# Altium schematic sheet 328P_Board.SchDoc: Plant Watering System
size A3; DrawnBy: Abzanov; Revision: 3.0; SheetNumber: 1; SheetTotal: 1
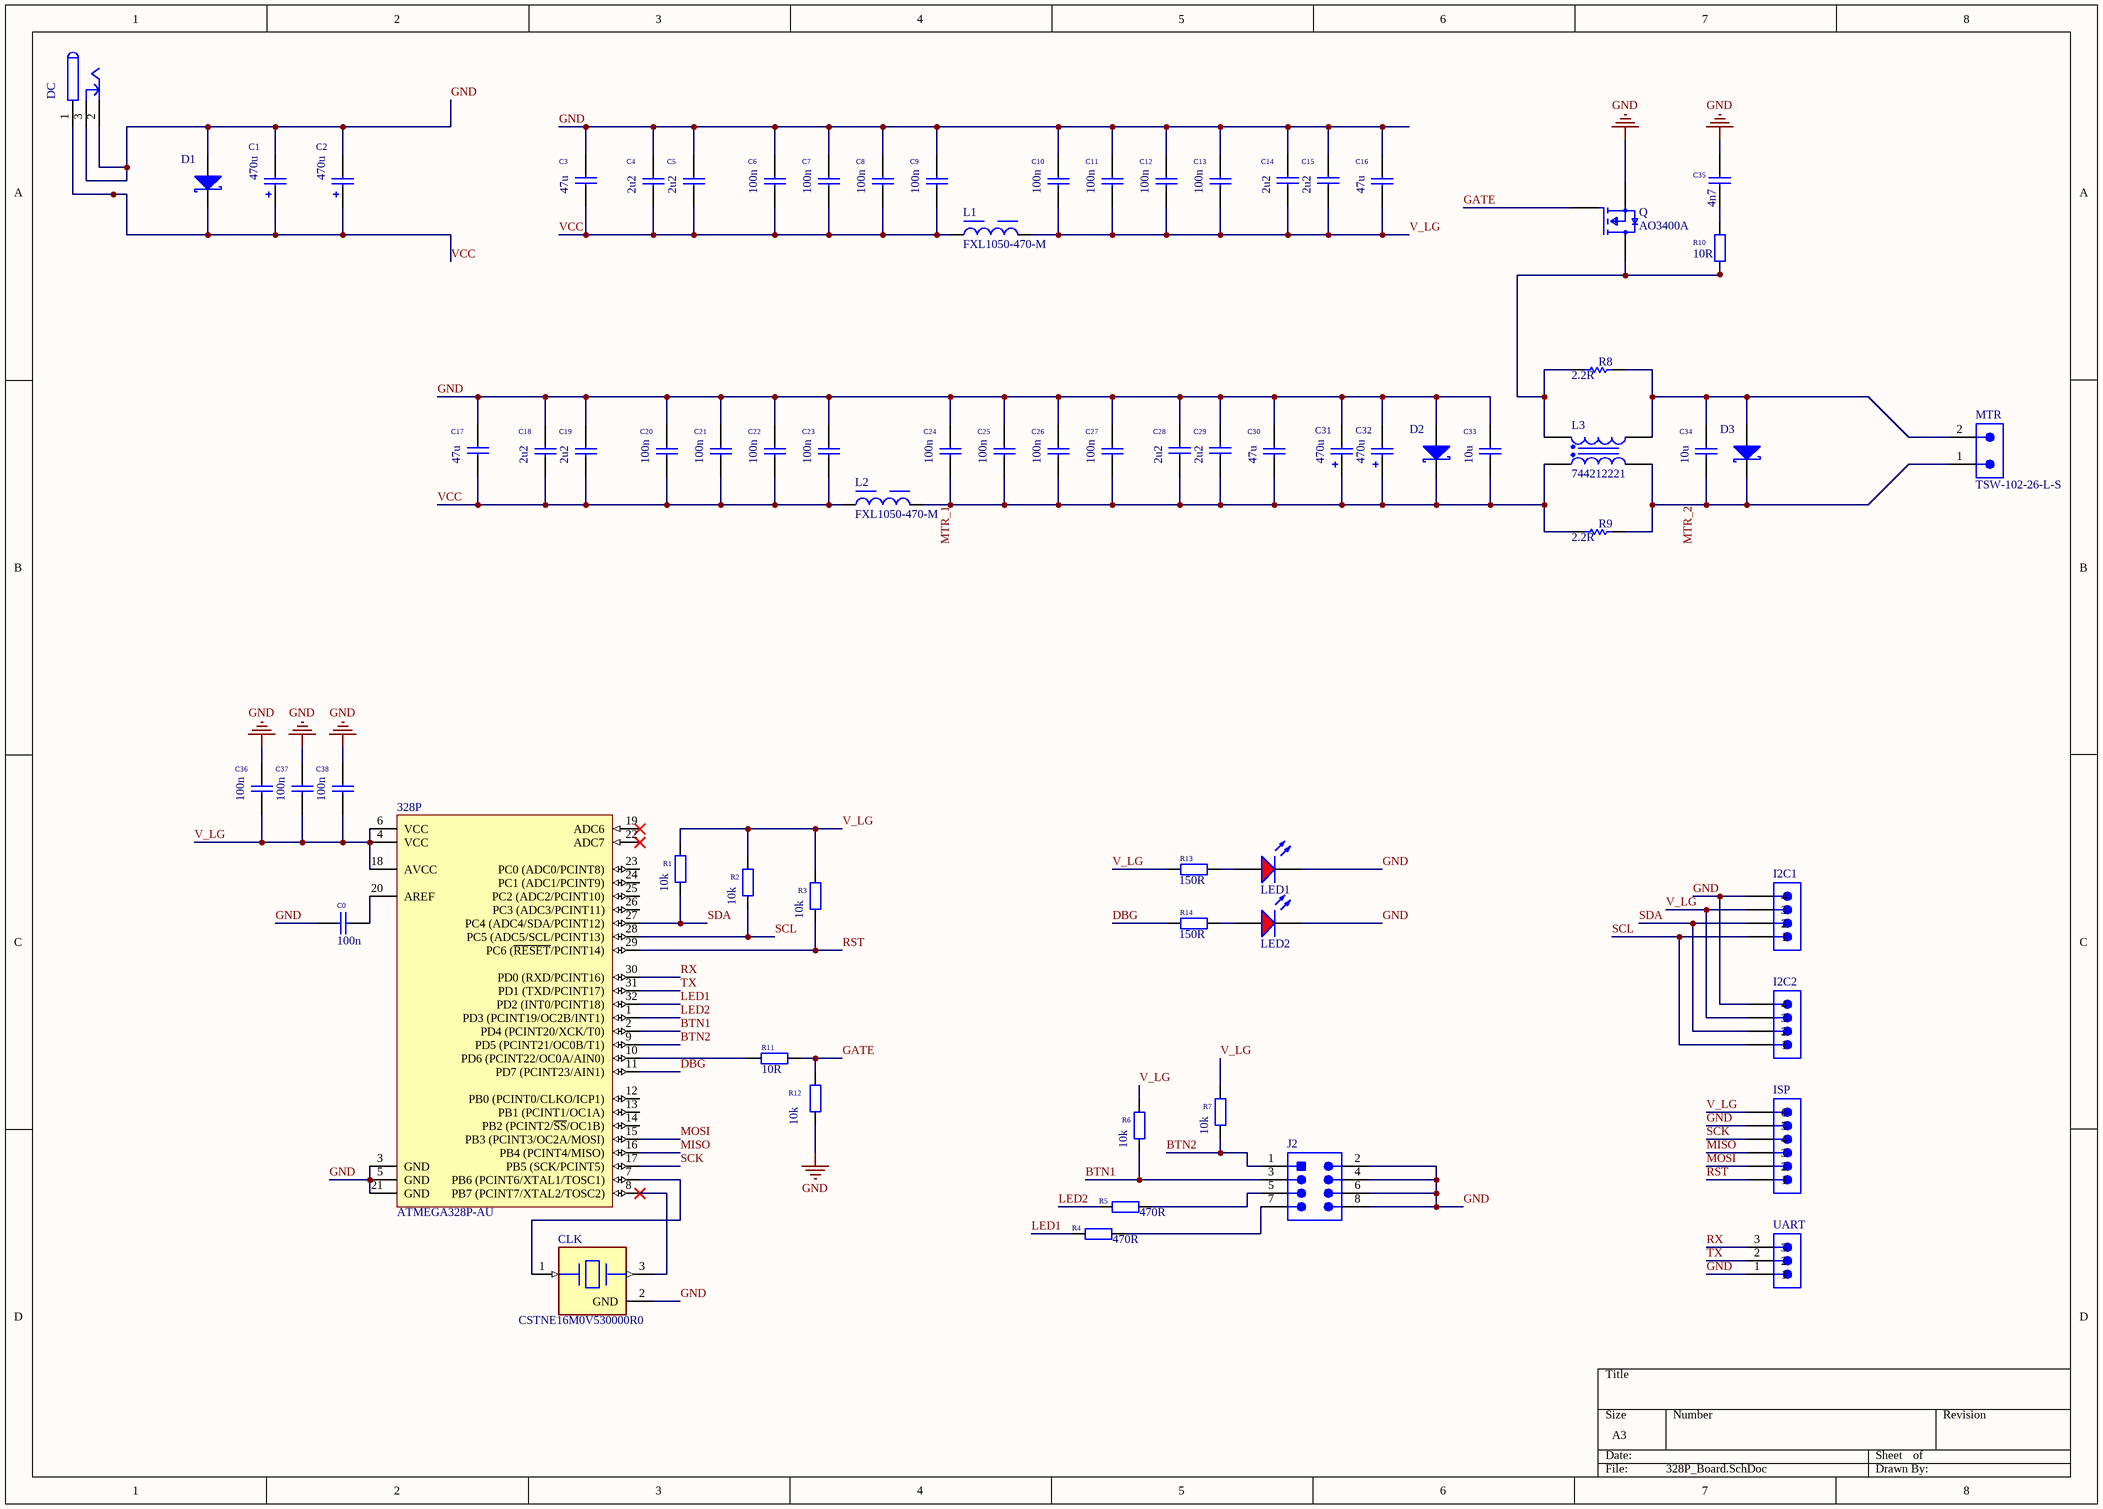
[diagram p0: 328P_Board.SchDoc]

## Parts
328P  ATMEGA328P-AU  [32A_L]
C0  100n  [CAPC1005X55]
C1  470u  [CAPAE100X105]
C2  470u  [CAPAE100X105]
C3  47u  [CAPC3225X270]
C4  2u2  [CAPC1608X90]
C5  2u2  [CAPC1608X90]
C6  100n  [CAPC1005X55]
C7  100n  [CAPC1005X55]
C8  100n  [CAPC1005X55]
C9  100n  [CAPC1005X55]
C10  100n  [CAPC1005X55]
C11  100n  [CAPC1005X55]
C12  100n  [CAPC1005X55]
C13  100n  [CAPC1005X55]
C14  2u2  [CAPC1608X90]
C15  2u2  [CAPC1608X90]
C16  47u  [CAPC3225X270]
C17  47u  [CAPC3225X270]
C18  2u2  [CAPC1608X90]
C19  2u2  [CAPC1608X90]
C20  100n  [CAPC1005X55]
C21  100n  [CAPC1005X55]
C22  100n  [CAPC1005X55]
C23  100n  [CAPC1005X55]
C24  100n  [CAPC1005X55]
C25  100n  [CAPC1005X55]
C26  100n  [CAPC1005X55]
C27  100n  [CAPC1005X55]
C28  2u2  [CAPC1608X90]
C29  2u2  [CAPC1608X90]
C30  47u  [CAPC3225X270]
C31  470u  [CAPAE100X105]
C32  470u  [CAPAE100X105]
C33  10u  [CAPC3216X180]
C34  10u  [CAPC3216X180]
C35  4n7  [CAPC1005X55]
C36  100n  [CAPC1005X55]
C37  100n  [CAPC1005X55]
C38  100n  [CAPC1005X55]
CLK  CSTNE16M0V530000R0  [FP-CSTNE16M0V530000R0-MFG]
D1  SSC54  [DIOM7959X262]  (value not drawn)
D2  SSC54  [DIOM7959X262]  (value not drawn)
D3  SSC54  [DIOM7959X262]  (value not drawn)
DC  694106301002  [KYCON_KLDX-0202]  (value not drawn)
I2C1  TSW-104-08-L-S  [SMTC-TSW-104-08-X-S]  (value not drawn)
I2C2  TSW-104-08-L-S  [SMTC-TSW-104-08-X-S]  (value not drawn)
ISP  TSW-106-07-L-S  [SMTC-TSW-106-07-X-S]  (value not drawn)
J2  TSW-104-08-L-D  [SMTC-TSW-104-08-L-D_V]  (value not drawn)
L1  FXL1050-470-M  [FXL1050-470-M-Footprint-1]
L2  FXL1050-470-M  [FXL1050-470-M-Footprint-1]
L3  744212221  [WE-SL1_L6.5W3.6H1.65]
LED1  Red  [LEDC2012X90]  (value not drawn)
LED2  Red  [LEDC2012X90]  (value not drawn)
MTR  TSW-102-26-L-S  [SMTC-TSW-102-26-XX-S]
Q  AO3400A  [FP-SOT23-IPC_C]
R1  10k  [RESC1005X40]
R2  10k  [RESC1005X40]
R3  10k  [RESC1005X40]
R4  470R  [RESC1005X40]
R5  470R  [RESC1005X40]
R6  10k  [RESC1005X40]
R7  10k  [RESC1005X40]
R8  value 2.2R  [RC2512JK-7W2R2L-Footprint-1]  (hidden comment: RC2512JK-7W2R2L)
R9  value 2.2R  [RC2512JK-7W2R2L-Footprint-1]  (hidden comment: RC2512JK-7W2R2L)
R10  10R  [RESC2012X65]
R11  10R  [RESC2012X65]
R12  10k  [RESC1005X40]
R13  150R  [RESC1005X40]
R14  150R  [RESC1005X40]
UART  TSW-103-07-T-S  [SMTC-TSW-103-07-X-S]  (value not drawn)

## Nets
GND: 328P.3(GND) 328P.5(GND) 328P.21(GND) C0.1 C1.2 C2.2 C3.1 C4.1 C5.1 C6.1 C7.1 C8.1 C9.1 C10.1 C11.1 C12.1 C13.1 C14.2 C15.2 C16.2 C17.1 C18.1 C19.1 C20.1 C21.1 C22.1 C23.1 C24.1 C25.1 C26.1 C27.1 C28.2 C29.2 C30.2 C31.2 C32.2 C33.2 C35.2 C36.1 C37.1 C38.1 CLK.2(GND) D1.2(A) D2.2(A) DC.2 DC.3 I2C1.4 I2C2.4 ISP.5 J2.2 J2.4 J2.6 J2.8 LED1.1(K) LED2.1(K) Q.2(S) R12.2 UART.1
BTN1: 328P.2(PD4_(PCINT20/XCK/T0)) J2.3 R6.2
BTN2: 328P.9(PD5_(PCINT21/OC0B/T1)) J2.1 R7.2
DBG: 328P.11(PD7_(PCINT23/AIN1)) R14.1
GATE: Q.1(G) R11.1 R12.1
LED1: 328P.32(PD2_(INT0/PCINT18)) R4.1
LED2: 328P.1(PD3_(PCINT19/OC2B/INT1)) R5.1
MISO: 328P.16(PB4_(PCINT4/MISO)) ISP.3
MOSI: 328P.15(PB3_(PCINT3/OC2A/MOSI)) ISP.2
MTR_1: C24.2 C25.2 C26.2 C27.2 C28.1 C29.1 C30.1 C31.1 C32.1 C33.1 D2.1(K) L2.2 L3.1 R9.1
MTR_2: C34.1 D3.1(K) L3.5 MTR.1 R9.2
RST: 328P.29(PC6_(~{RESET}/PCINT14)) ISP.1 R3.2
RX: 328P.30(PD0_(RXD/PCINT16)) UART.3
SCK: 328P.17(PB5_(SCK/PCINT5)) ISP.4
SCL: 328P.28(PC5_(ADC5/SCL/PCINT13)) I2C1.1 I2C2.1 R2.2
SDA: 328P.27(PC4_(ADC4/SDA/PCINT12)) I2C1.2 I2C2.2 R1.2
TX: 328P.31(PD1_(TXD/PCINT17)) UART.2
V_LG: 328P.4(VCC) 328P.6(VCC) 328P.18(AVCC) C10.2 C11.2 C12.2 C13.2 C14.1 C15.1 C16.1 C36.2 C37.2 C38.2 I2C1.3 I2C2.3 ISP.6 L1.2 R1.1 R2.1 R3.1 R6.1 R7.1 R13.1
VCC: C1.1 C2.1 C3.2 C4.2 C5.2 C6.2 C7.2 C8.2 C9.2 C17.2 C18.2 C19.2 C20.2 C21.2 C22.2 C23.2 D1.1(K) DC.1 L1.1 L2.1
Net328P_7: 328P.7(PB6_(PCINT6/XTAL1/TOSC1)) CLK.1(Input)
Net328P_8: 328P.8(PB7_(PCINT7/XTAL2/TOSC2)) CLK.3(Output)
Net328P_10: 328P.10(PD6_(PCINT22/OC0A/AIN0)) R11.2
Net328P_20: 328P.20(AREF) C0.2
NetC34_2: C34.2 D3.2(A) L3.4 MTR.2 R8.2
NetC35_1: C35.1 R10.2
NetJ2_5: J2.5 R5.2
NetJ2_7: J2.7 R4.2
NetL3_3: L3.3 Q.3(D) R8.1 R10.1
NetLED1_2: LED1.2(A) R13.2
NetLED2_2: LED2.2(A) R14.2

Not connected (* = marked no-connect by the designer): 328P 12(PB0_(PCINT0/CLKO/ICP1)) 13(PB1_(PCINT1/OC1A)) 14(PB2_(PCINT2/~{SS}/OC1B)) 19(ADC6)* 22(ADC7)* 23(PC0_(ADC0/PCINT8)) 24(PC1_(ADC1/PCINT9)) 25(PC2_(ADC2/PCINT10)) 26(PC3_(ADC3/PCINT11))

## Library data of the parts
328P = CMP-00014-1: RISC Microcontroller, 8-Bit, FLASH, AVR RISC CPU, 20MHz, CMOS, PQFP32; Qualification Status: Not Qualified; Power Supplies: 2.5; Package Body Material: Plastic; Peripherals: POR,PWM,WDT; Max Supply Voltage: 5.5V; Number of I/O Lines: 23; Min Supply Voltage: 4.5V; Max Supply Current: 9mA; Interface: SPI,USART; Time @ Peak Reflow Temperature-Max (s): 40s; Nominal Supply Voltage: 5V; Height - Seated (Max): 1.2mm; RoHS Compliant: Yes; Terminal Form: Gull Wing; JESD-30 Code: S-PQFP-G32; Peak Reflow Temperature (Cel): 260°C; Package Shape: Square; Temperature Grade: INDUSTRIAL; Technology: CMOS; Terminal Position: QUAD; Case/Package: TQFP; Reach SVHC Compliant: Yes; Surface Mount: Yes; Width: 7mm; Terminal Pitch: 0.8mm; Clock Frequency: 20MHz; Terminal Finish: Tin; Max Operating Temperature: 85°C; Length: 7mm; JESD-609 Code: e3; Min Operating Temperature: -40°C; Moisture Sensitivity Level: 3; Pins: 32
C0 C6-C13 C20-C27 C36-C38 = 1066: Ceramic Chip Capacitor; Manufacturer: Kemet; Manufacturer ID: C0402C104K4RAC; ID: 1066; Type: MLCC; Voltage: 16V; Characteristic: X7R; Tolerance: ±15%; UBiKS Number: UBiKS-C00001I; Value: 100n; Dielectric: Ceramic; Footprint / Size: C0402; Farnell: 1288252; Digikey: 399-3521-1-ND; Distributor 3: Mouser; Distributor Number 3: 80-C0402C104K4RAUTO; LCSC Part Number: C1525; Unit Price: 0; Quantity: 0; ComponentLink1Description: Website; ComponentLink1URL: http://kemet.com/; ComponentLink2Description: Datasheet; ComponentLink2URL: http://www.kemet.com/kemet/web/homepage/kechome.nsf/vapubfiles/F3102_X7R.pdf/$file/F3102_X7R.pdf
C1 C2 C31 C32 = 1097: Aluminum Electrolytic Capacitors; Manufacturer: Panasonic; Manufacturer ID: EEE-FK1E471P; ID: 1097; Type: Aluminium/Electrolytic; Voltage: 25V; Tolerance: ±20%; UBiKS Number: UBiKS-C00031X; Value: 470u; Dielectric: Electrolyt; Footprint / Size: CAPAE10083X102M; Farnell: 9695800; Digikey: PCE3805CT-ND; Distributor 4: Wuerth Elektronik; Distributor Number 4: 865080457015; Unit Price: 0; Quantity: 0; ComponentLink1Description: Website; ComponentLink1URL: http://industrial.panasonic.com/; ComponentLink2Description: Datasheet; ComponentLink2URL: http://industrial.panasonic.com/www-data/pdf/ABA0000/ABA0000CE120.pdf
C3 C16 C17 C30 = 1207: Ceramic Chip Capacitor; Manufacturer: Taiyo Yuden; Manufacturer ID: EMK325BJ476MM-T; ID: 1207; Type: MLCC; Voltage: 16V; Characteristic: X5R; Tolerance: ±20%; UBiKS Number: UBiKS-C00115P; Value: 47u; Dielectric: Ceramic; Footprint / Size: C1210; Farnell: 1611919; Digikey: 587-1436-2-ND; Unit Price: 0; Quantity: 0; ComponentLink1Description: Website; ComponentLink1URL: http://www.yuden.co.jp/; ComponentLink2Description: Datasheet; ComponentLink2URL: http://www.yuden.co.jp/ut/product/pdf/djmk_e.pdf
C4 C5 C14 C15 C18 C19 C28 C29 = 1206: Ceramic Chip Capacitor; Manufacturer: Kemet; Manufacturer ID: C0603C225K4PACTU; ID: 1206; Type: MLCC; Voltage: 16V; Characteristic: X5R; Tolerance: ±10%; UBiKS Number: UBiKS-C00114J; Value: 2u2; Dielectric: Ceramic; Footprint / Size: C0603; Farnell: 1288203; ComponentLink1Description: Website; ComponentLink1URL: http://kemet.com/; ComponentLink2Description: Datasheet; ComponentLink2URL: http://www.kemet.com/kemet/web/homepage/kechome.nsf/vapubfiles/F3102_X5R.pdf/$file/F3102_X5R.pdf
C33 C34 = 1283: Ceramic Chip Capacitor; Manufacturer: Samsung; Manufacturer ID: CL31A106MBHNNNE; ID: 1283; Type: MLCC; Voltage: 50V; Characteristic: X5R; Tolerance: ±20%; UBiKS Number: UBiKS-C00170P; Value: 10u; Dielectric: Ceramic; Footprint / Size: C1206; Digikey: 1276-6736-1-ND; Distributor Number 3: 187-CL31B106KBHNNNE; Distributor 4: Wuerth Elektronik; Distributor Number 4: 885012108022; LCSC Part Number: C13585; ComponentLink1Description: Website; ComponentLink1URL: https://www.samsungsem.com/; ComponentLink2Description: Datasheet; ComponentLink2URL: www.samsungsem.com/kr/support/product-search/mlcc/CL21A475KBQNNNE.jsp
C35 = 1086: Ceramic Chip Capacitor; Manufacturer: Kemet; Manufacturer ID: C0402C472K5RAC; ID: 1086; Type: MLCC; Voltage: 50V; Characteristic: X7R; Tolerance: ±15%; UBiKS Number: UBiKS-C00021S; Value: 4n7; Dielectric: Ceramic; Footprint / Size: C0402; Farnell: 1414594; Unit Price: 0; Quantity: 0; ComponentLink1Description: Website; ComponentLink1URL: http://kemet.com/; ComponentLink2Description: Datasheet; ComponentLink2URL: http://www.kemet.com/kemet/web/homepage/kechome.nsf/vapubfiles/F3102_X7R.pdf/$file/F3102_X7R.pdf
CLK = CMP-00020-1: Ceramic Resonator, 16MHz Nom; Frequency Tolerance: 5000ppm; Frequency Stability: 0.3%; Operating Frequency-Nom: 160; Reach SVHC Compliant: Yes; Min Operating Temperature: -40°C; Crystal/Resonator Type: CERAMIC RESONATOR; Mounting Technology: Surface Mount; Max Operating Temperature: 85°C; RoHS Compliant: Yes
D1-D3 = 4003: Schottky Diode; Manufacturer: Vishay; Manufacturer ID: SSC54-E3/9AT; ID: 4003; UBiKS Number: UBiKS-D00002P; Type: Schottky; Footprint / Size: D_SMC; Farnell: 1336559; Digikey: SSC54-E3/9ATGICT-ND; Distributor 3: Mouser; Distributor Number 3: 625-SSC54-E3/9AT; LCSC Part Number: C16103; ComponentLink1Description: Website; ComponentLink1URL: http://www.vishay.com/; ComponentLink2Description: Datasheet; ComponentLink2URL: http://www.vishay.com/docs/88885/88885.pdf
DC = 9655: DC Power Jack, 5.5x2.1mm, 6.4mm Opening DC power jack; Manufacturer: Wuerth Elektronik; ID: 9655; Value: 3; Pitch: 4.00mm; SMD/THT: THT; Serie: WR-DC; UBiKS Number: UBiKS-P00127T; Type: W2B - Power; Manufacturer ID: 694106301002; Orientation: H; Footprint / Size: DCJACK-5.5x2.1; Distributor 3: Mouser; Distributor Number 3: 806-KLDX-0202-A; Distributor 4: Wuerth Elektronik; Distributor Number 4: 694106301002; ComponentLink1Description: Website; ComponentLink1URL: https://www.we-online.com/en/components/products/DC_RIGHT_ANGLED_6_4_69410X301002; ComponentLink2Description: Datasheet; ComponentLink2URL: https://www.we-online.com/components/media/o664242v410%20info-wr-dc-power-jacks-connector.pdf
I2C1 I2C2 = CMP-00016-1: Board Connector, 4 Contact(s), 1 Row(s), Male, Straight, Solder Terminal; Manufacturer Series: TSW; Mating Information: MULTIPLE MATING PARTS AVAILABLE; Additional Feature: E.L.P.; IEC Conformance: No; Number of Contacts: 4; Option: General Purpose; Number of Rows Loaded: 1; Terminal Pitch: 2.54mm; RoHS Compliant: Yes; Contact Material: Bronze; Connector Type: BOARD CONNECTOR; Contact Finish - Mating: GOLD (10) OVER NICKEL (50); Mounting Style: STRAIGHT; JESD-609 Code: e3; MIL Conformance: No; Termination: Solder; Contact Finish - Termination: MATTE TIN OVER NICKEL (50); Filter Feature: No; Reach SVHC Compliant: Yes; DIN Conformance: No; Mixed Contacts: No; Contact Gender: Male; Mounting Technology: Board
ISP = CMP-00027-1: Board Connector, 6 Contact(s), 1 Row(s), Male, Straight, 0.1 inch Pitch, Solder Terminal, Black Insulator, Receptacle; DIN Conformance: No; Number Of Connectors: 1; Reference Standard: UL; PCB Contact Pattern: RECTANGULAR; Reliability: COMMERCIAL; Option: General Purpose; Number of Contacts: 6; Plating Thickness: 10uin; Mating Information: MULTIPLE MATING PARTS AVAILABLE; Additional Feature: E.L.P.; Contact Style: SQ PIN-SKT; Terminal Length: 0.1inch; Mixed Contacts: No; MIL Conformance: No; Terminal Pitch: 2.54mm; Body Breadth: 0.1inch; Body/Shell Style: RECEPTACLE; Body Depth: 0.1inch; Filter Feature: No; Termination: Solder; Contact Material: Bronze; Number Of PCB Rows: 1; Contact Gender: Male; Insulation Material: Glass; Contact Finish - Termination: Matte Tin (Sn) - with Nickel (Ni) barrier; Reach SVHC Compliant: Yes; Connector Type: BOARD CONNECTOR; Contact Pattern: RECTANGULAR; Insulation Color: Black; JESD-609 Code: e3; Contact Finish - Mating: GOLD (10) OVER NICKEL (50); Number of Rows Loaded: 1; RoHS Compliant: Yes; Mounting Style: STRAIGHT; IEC Conformance: No; Mating Contact Pitch: 0.1inch; Mounting Technology: Board; Flammability Rating: UL94 V-0
J2 = CMP-00029-1: Board Connector, 8 Contact(s), 2 Row(s), Male, Straight, 0.1 inch Pitch, Solder Terminal, Black Insulator, Receptacle; DIN Conformance: No; Mating Information: MULTIPLE MATING PARTS AVAILABLE; Plating Thickness: 10uin; Contact Pattern: RECTANGULAR; Additional Feature: E.L.P.; Number of Rows Loaded: 2; Reference Standard: UL; Reliability: COMMERCIAL; Number of Contacts: 8; Option: General Purpose; Number Of Connectors: 1; Contact Style: SQ PIN-SKT; PCB Contact Row Spacing: 5.08mm; Contact Finish - Termination: Matte Tin (Sn) - with Nickel (Ni) barrier; Mixed Contacts: No; MIL Conformance: No; Connector Type: BOARD CONNECTOR; Contact Material: Bronze; Terminal Length: 0.2inch; Contact Finish - Mating: GOLD (10) OVER NICKEL (50); Filter Feature: No; IEC Conformance: No; Terminal Pitch: 2.54mm; PCB Contact Pattern: RECTANGULAR; Mating Contact Pitch: 0.1inch; Reach SVHC Compliant: Yes; RoHS Compliant: Yes; Body Breadth: 0.1inch; Body/Shell Style: RECEPTACLE; Number Of PCB Rows: 2; Mating Contact Row Spacing: 0.1inch; JESD-609 Code: e3; Insulation Material: Glass; Mounting Technology: Board; Contact Gender: Male; Termination: Solder; Insulation Color: Black; Mounting Style: STRAIGHT; Body Depth: 0.1inch
L1 L2 = CMP-00038-1
L3 = CMP-00022-1: Data Line Filter, 2 Function(s), 80V, 0.3A, 4 Pin(s); Current Rating: 300mA; DC Resistance-Max: 280mR; Approvals: ULV; Output Impedance: 1.2kR; Value: 220uH; Channels: 2; Width: 3.6mm; Terminal Finish: Copper; Reach SVHC Compliant: Yes; Length: 6.5mm; Max Operating Temperature: 105°C; Height: 1.65mm; JESD-609 Code: e1; RoHS Compliant: Yes; Voltage Rating: 80V; Filter Type: DATA LINE FILTER; Min Operating Temperature: -40°C; Packaging: Tape and Reel; Mounting Technology: Surface Mount
LED1 LED2 = 6010: SMD Chip LED; Manufacturer: Avago; Manufacturer ID: HSMS-C170; ID: 6010; Type: Standard LED; UBiKS Number: UBiKS-V00002H; Color: red; Footprint / Size: LED0805; Farnell: 5790839; Digikey: 160-1422-6-ND; Distributor 3: Mouser; Distributor Number 3: 630-HSMS-C170; Distributor 4: Wuerth; Distributor Number 4: 150080RS75000; ComponentLink1Description: Website; ComponentLink1URL: http://www.avagotech.com/; ComponentLink2Description: Datasheet; ComponentLink2URL: http://www.avagotech.com/docs/AV02-0376EN; LCSC Part Number: C84256
MTR = CMP-00036-2: Board Connector, 2 Contact(s), 1 Row(s), Male, Straight, 0.1 inch Pitch, Solder Terminal, Black Insulator, Receptacle; Reference Standard: UL; Mating Information: MULTIPLE MATING PARTS AVAILABLE; PCB Contact Pattern: RECTANGULAR; Plating Thickness: 10uin; Number of Rows Loaded: 1; Reliability: COMMERCIAL; Option: General Purpose; DIN Conformance: No; Additional Feature: E.L.P.; Number of Contacts: 2; Contact Style: SQ PIN-SKT; Mounting Technology: Board; Terminal Length: 0.126inch; Connector Type: BOARD CONNECTOR; Insulation Material: Glass; Terminal Pitch: 2.54mm; Contact Finish - Termination: Matte Tin (Sn) - with Nickel (Ni) barrier; Contact Gender: Male; Body Depth: 0.1inch; Number Of Connectors: 1; IEC Conformance: No; Body Breadth: 0.1inch; MIL Conformance: No; Flammability Rating: UL94 V-0; Number Of PCB Rows: 1; Mounting Style: STRAIGHT; Contact Pattern: RECTANGULAR; Mating Contact Pitch: 0.1inch; RoHS Compliant: Yes; Contact Material: Bronze; JESD-609 Code: e3; Filter Feature: No; Termination: Solder; Contact Finish - Mating: GOLD (10) OVER NICKEL (50); Reach SVHC Compliant: Yes; Insulation Color: Black; Body/Shell Style: RECEPTACLE; Mixed Contacts: No
Q = CMP-00027-1: Small Signal Field-Effect Transistor, 5.7A I(D), 30V, 1-Element, N-Channel, Silicon, Metal-oxide Semiconductor FET; Operating Mode: ENHANCEMENT MODE; Drain-source On Resistance-Max: 26.5mR; Number of Elements: 1; Transistor Application: SWITCHING; Package Body Material: Plastic; Drain Current-Max (ID): 5.7A; Surface Mount: Yes; Package Style: SMALL OUTLINEMeter; Polarity/Channel Type: N-CHANNEL; Package Shape: Rectangular; Reach SVHC Compliant: Yes; FET Technology: METAL-OXIDE SEMICONDUCTOR; Terminal Position: DUAL; Pins: 3; Transistor Element Material: SILICON; DS Breakdown Voltage-Min: 30V; JESD-30 Code: R-PDSO-G3; Terminal Form: Gull Wing; RoHS Compliant: Yes
R1-R3 R6 R7 R12 = 2123: Resistor; Manufacturer: Multicomp; Manufacturer ID: MC 0.0625W 0402 1% 10K; ID: 2123; Element Type: Thick Film; Tolerance: ±1%; Power rating: 0.063W; Temperatur coeff: ±100ppm/°C; UBiKS Number: UBiKS-R00007H; Type: Standard; Value: 10k; Footprint / Size: R0402; Farnell: 1358069; LCSC Part Number: C25744; ComponentLink1Description: Website; ComponentLink2Description: Datasheet; ComponentLink2URL: http://www.farnell.com/datasheets/318400.pdf
R4 R5 = 2151: Resistor; Manufacturer: Multicomp; Manufacturer ID: MC 0.0625W 0402 1% 470R; ID: 2151; Element Type: Thick Film; Tolerance: ±1%; Power rating: 0.063W; Temperatur coeff: ±100ppm/°C; UBiKS Number: UBiKS-R00035K; Type: Standard; Value: 470R; Footprint / Size: R0402; Farnell: 1358034; LCSC Part Number: C25117; ComponentLink1Description: Website; ComponentLink2Description: Datasheet; ComponentLink2URL: http://www.farnell.com/datasheets/318400.pdf
R8 R9 = CMP-00021-2: Fixed Resistor, Metal Glaze/thick Film, 2W, 2.2ohm, 200V, 5% +/-Tol, 200ppm/Cel, Surface Mount, 2512; Package Width: 3.1mm; Package Length: 6.35mm; Additional Feature: LASER TRIMMABLE; Temperature Coefficient (ppm/Cel): 200; Rated Temperature: 70°C; Package Height: 0.55mm; RoHS Compliant: Yes; Technology: METAL GLAZE/THICK FILM; Min Operating Temperature: -55°C; JESD-609 Code: e3; Packaging: Tape and Reel; Construction: Chip; Mounting Technology: Surface Mount; Resistor Type: FIXED RESISTOR; Working Voltage: 200V; Pins: 2; Terminal Finish: Nickel; Termination: Wraparound; Case/Package: 2512; Max Operating Temperature: 155°C; Power: 2W; Tolerance: 5%; Reach SVHC Compliant: Yes; Package Shape: Rectangular
R10 R11 = 2526: Resistor; Manufacturer: Multicomp; Manufacturer ID: MC 0.1W 0805 1% 10R; ID: 2526; Element Type: Thick Film; Tolerance: ±1%; Power rating: 0.1W; Temperatur coeff: ±200ppm/°C; UBiKS Number: UBiKS-R00342J; Type: Standard; Value: 10R; Footprint / Size: R0805; Farnell: 9332421; LCSC Part Number: C17415; Unit Price: 0; Quantity: 0; ComponentLink1Description: Website; ComponentLink2Description: Datasheet; ComponentLink2URL: http://www.farnell.com/datasheets/34922.pdf
R13 R14 = 2219: Resistor; Manufacturer: Multicomp; Manufacturer ID: MC 0.0625W 0402 1% 150R; ID: 2219; Element Type: Thick Film; Tolerance: ±1%; Power rating: 0.063W; Temperatur coeff: ±100ppm/°C; UBiKS Number: UBiKS-R00096U; Type: Standard; Value: 150R; Footprint / Size: R0402; Farnell: 1358020; LCSC Part Number: C25082; ComponentLink1Description: Website; ComponentLink2Description: Datasheet; ComponentLink2URL: http://www.farnell.com/datasheets/318400.pdf
UART = CMP-00028-1: Board Connector, 3 Contact(s), 1 Row(s), Male, Straight, 0.1 inch Pitch, Solder Terminal, Black Insulator, Receptacle; Additional Feature: E.L.P.; Number of Rows Loaded: 1; MIL Conformance: No; Number of Contacts: 3; Reference Standard: UL; Option: General Purpose; Mating Information: MULTIPLE MATING PARTS AVAILABLE; Reliability: COMMERCIAL; Contact Pattern: RECTANGULAR; Contact Style: SQ PIN-SKT; Termination: Solder; Reach SVHC Compliant: Yes; Terminal Length: 0.1inch; Insulation Material: Glass; Filter Feature: No; Body Depth: 0.1inch; Contact Finish - Mating: MATTE TIN OVER NICKEL (50); Body/Shell Style: RECEPTACLE; Flammability Rating: UL94 V-0; Number Of Connectors: 1; Mixed Contacts: No; Contact Finish - Termination: Tin (Sn) - with Nickel (Ni) barrier; Insulation Color: Black; Mounting Technology: Board; DIN Conformance: No; IEC Conformance: No; JESD-609 Code: e3; Connector Type: BOARD CONNECTOR; Mounting Style: STRAIGHT; Mating Contact Pitch: 0.1inch; Terminal Pitch: 2.54mm; RoHS Compliant: Yes; PCB Contact Pattern: RECTANGULAR; Contact Gender: Male; Body Breadth: 0.1inch; Number Of PCB Rows: 1; Contact Material: Bronze